# Altium schematic sheet Opto Sensors.SchDoc: Opto Sensors
size A4; DrawnBy: AT; SheetNumber: 3; SheetTotal: 5
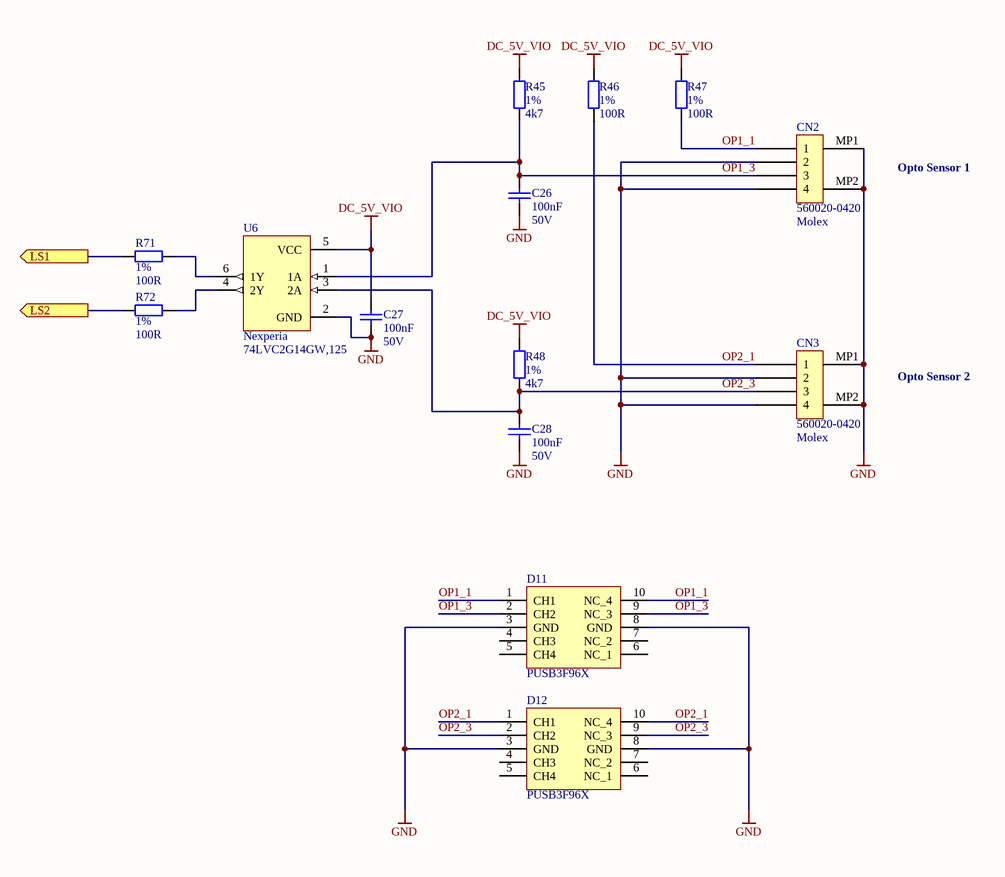
[diagram p0: Opto Sensors.SchDoc]

## Parts
C26  value 100nF  Voltage: 50V  [C0603]  (hidden comment: 100nF 0603 Ceramic Capacitor, 10%, X7R, 50V)
C27  value 100nF  Voltage: 50V  [C0603]  (hidden comment: 100nF 0603 Ceramic Capacitor, 10%, X7R, 50V)
C28  value 100nF  Voltage: 50V  [C0603]  (hidden comment: 100nF 0603 Ceramic Capacitor, 10%, X7R, 50V)
CN2  560020-0420  Manufacturer: Molex  [5600200420]
CN3  560020-0420  Manufacturer: Molex  [5600200420]
D11  ManufacturerPN: PUSB3F96X  [DFN2510A-10]  (hidden comment: TVS DIODE 5.5V 4.6V 10DFN2510)
D12  ManufacturerPN: PUSB3F96X  [DFN2510A-10]  (hidden comment: TVS DIODE 5.5V 4.6V 10DFN2510)
R45  value 4k7  Tolerance: 1%  [R0603]  (hidden comment: 4k7 0603 Chip Resistor, 1%, 0.1W)
R46  value 100R  Tolerance: 1%  [R0603]  (hidden comment: 100R 0603 Chip Resistor, 1%, 0.1W)
R47  value 100R  Tolerance: 1%  [R0603]  (hidden comment: 100R 0603 Chip Resistor, 1%, 0.1W)
R48  value 4k7  Tolerance: 1%  [R0603]  (hidden comment: 4k7 0603 Chip Resistor, 1%, 0.1W)
R71  value 100R  Tolerance: 1%  [R0603]  (hidden comment: 100R 0603 Chip Resistor, 1%, 0.1W)
R72  value 100R  Tolerance: 1%  [R0603]  (hidden comment: 100R 0603 Chip Resistor, 1%, 0.1W)
U6  Manufacturer: Nexperia  ManufacturerPN: 74LVC2G14GW,125  [SOT-363]  (hidden comment: 74LVC2G14GW Dual Schmitt Trigger Inverter)

## Ports
LS1 (out), LS2 (out)

## Nets
DC_5V_VIO: C27.2 R45.2 R46.2 R47.2 R48.2 U6.5(VCC)
GND: C26.1 C27.1 C28.1 CN2.2 CN2.4 CN2.MP1 CN2.MP2 CN3.2 CN3.4 CN3.MP1 CN3.MP2 D11.3(GND) D11.8(GND) D12.3(GND) D12.8(GND) U6.2(GND)
LS1: R71.1 ; port LS1
LS2: R72.1 ; port LS2
OP1_1: CN2.1 D11.1(CH1) D11.10(NC_4) R47.1
OP1_3: C26.2 CN2.3 D11.2(CH2) D11.9(NC_3) R45.1 U6.1(1A)
OP2_1: CN3.1 D12.1(CH1) D12.10(NC_4) R46.1
OP2_3: C28.2 CN3.3 D12.2(CH2) D12.9(NC_3) R48.1 U6.3(2A)
NetR71_2: R71.2 U6.6(1Y)
NetR72_2: R72.2 U6.4(2Y)

Not connected (* = marked no-connect by the designer): D11 4(CH3) 5(CH4) 6(NC_1) 7(NC_2); D12 4(CH3) 5(CH4) 6(NC_1) 7(NC_2)

## Notes on the sheet
- Opto Sensor 1
- Opto Sensor 2
- Title
- Size:
- Date:
- A4
- Drawn By:
- Time:
- Revision:
- Sheet
- of
- CircuitBuilder
- +44 (0)330 133 0606
- info@circuit-builder.com
- File:

## Library data of the parts
C26-C28 = 100nF 0603 Ceramic Capacitor, 10%, X7R, 50V: Manufacturer: AVX; ManufacturerPN: 06035C104KAZ2A; Cost-10000: 0.0192; Supplier1: Farnell; Supplier1PN: 1301894; Cost: 0.0671; Package: 0603; Tolerance: 10%; Supplier2: Open Market; Supplier1PNProto: 1301894
CN2 CN3 = 5600200420: Vertical SMT Header, 4-Way, 2mm Pitch; Cost-10000: 1; Circuits (maximum): 4; Supplier1: Digikey; Supplier1PN: WM10864TR-ND; Cost: 1.29; Supplier1PNProto: WM10864CT-ND; ManufacturerPN: 5600200420; Circuits (Loaded): 4; Mounting Technology: Surface Mount; Number of Rows: 1
D11 D12 = TVS DIODE 5.5V 4.6V 10DFN2510: 4.6V (Typ) Clamp 5.2A (8/20µs) Ipp Tvs Diode Surface Mount DFN2510A-10; Manufacturer: Nexperia USA Inc.; Cost-10000: 0.10268; Supplier1: Digikey; Supplier1PN: 1727-2030-2-ND; Cost: 0.39; Package: DFN2510A-10; Supplier1PNProto: 1727-2030-1-ND
R45 R48 = 4k7 0603 Chip Resistor, 1%, 0.1W: Manufacturer: Samsung Electro-Mechanics America, Inc; ManufacturerPN: RC1608F472CS; Flex Part Number: ROL-F130-1087; Cost-10000: 0.00099; Supplier1: Digikey; Supplier1PN: 1276-3502-2-ND; Cost: 0.07; Supplier2: Open Market; Supplier1PNProto: 1276-3502-1-ND
R46 R47 R71 R72 = 100R 0603 Chip Resistor, 1%, 0.1W: Manufacturer: Yageo; ManufacturerPN: RC0603FR-07100RL; Cost-10000: 0.003; ProductionCost: 0.0016; Supplier1: Digikey; Supplier1PN: 311-100HRTR-ND; Cost: 0.08; Supplier2: Open Market; Supplier1PNProto: 311-100HRCT-ND; ProductionSupplier: LCSC; ProductionSupplierPN: C105588
U6 = 74LVC2G14GW Dual Schmitt Trigger Inverter: Cost-10000: 0.04477; Supplier1: Digikey; Supplier1PN: 1727-4217-2-ND; Cost: 0.30; Supplier1PNProto: 1727-4217-1-ND